# Altium schematic sheet POWER.SchDoc
size A4
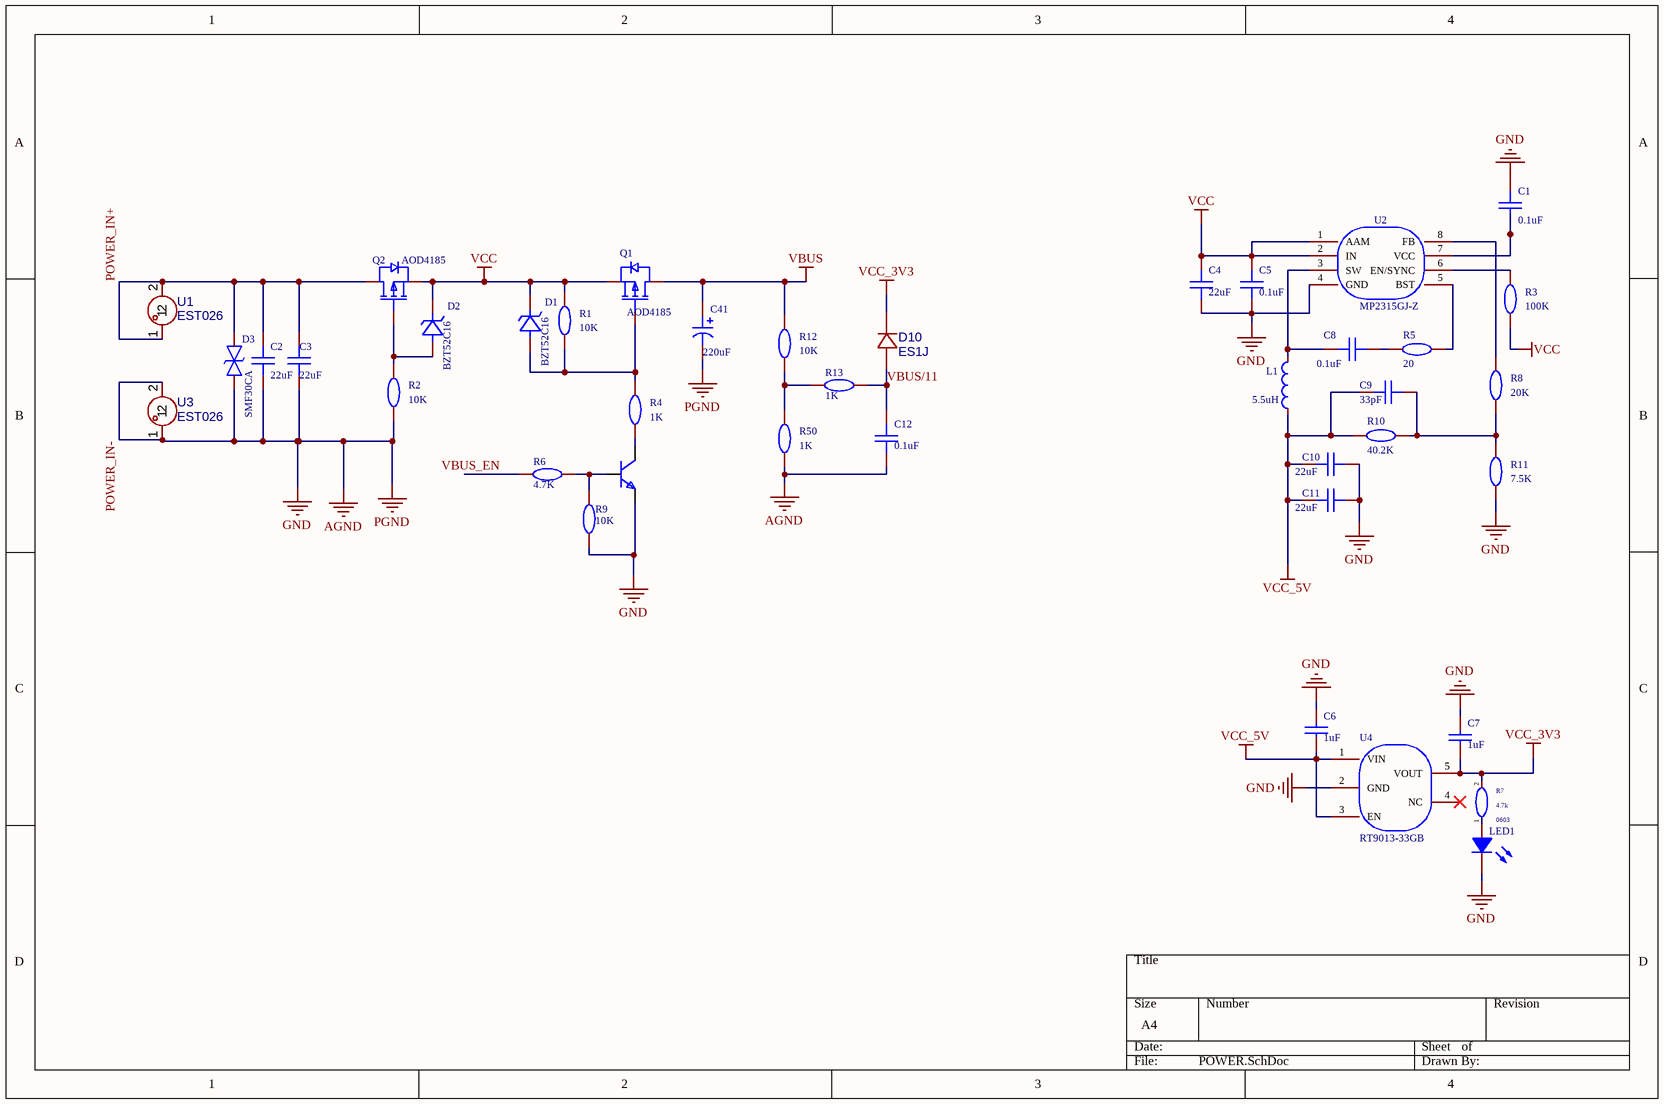
[diagram p0: POWER.SchDoc]

## Parts
C1  0.1uF  [C0603]
C2  22uF  [C0603]
C3  22uF  [C0603]
C4  22uF  [C0603]
C5  0.1uF  [C0603]
C6  1uF  [C0603]
C7  1uF  [C0603]
C8  0.1uF  [C0603]
C9  33pF  [C0603]
C10  22uF  [C0805]
C11  22uF  [C0805]
C12  0.1uF  [C0603]
C41  220uF  [CAP-SMD_BD6.3-L6.6-W6.6-FD]
D1  BZT52C16  [SOD-123_L2.7-W1.6-LS3.7-RD]
D2  BZT52C16  [SOD-123_L2.7-W1.6-LS3.7-RD]
D3  SMF30CA  [SOD-123_L2.7-W1.8-LS3.7-BI]
D10  ES1J  [SMA_L4.4-W2.8-LS5.4-RD]
L1  5.5uH  [IND-SMD_L10.5-W10.2-HSB-1050]
LED1  (no value)  [LED_0603]
Q1  AOD4185  [TO-252-2_L6.6-W6.1-P4.57-LS9.9-BR-CW]
Q2  AOD4185  [TO-252-2_L6.6-W6.1-P4.57-LS9.9-BR-CW]
Q3  s8050_c20069125  [SOT-23-3_L2.9-W1.3-P1.90-LS2.3-BR]  (value not drawn)
R1  10K  [R0603]
R2  10K  [R0603]
R3  100K  [R0603]
R4  1K  [R0603]
R5  20  [R0603]
R6  4.7K  [R0603]
R7  value 4.7k  Footprint_1: 0603  [R0603]  (hidden comment: My_Library_Res-0603)
R8  20K  [R0603]
R9  10K  [R0603]
R10  40.2K  [R0603]
R11  7.5K  [R0603]
R12  10K  [R0603]
R13  1K  [R0603]
R50  1K  [R0603]
U1  EST026  [CONN-TH_L6.3-W0.8-EST026]
U2  MP2315GJ-Z  [TSOT-23-8_L2.9-W1.6-P0.65-LS2.8-BR]
U3  EST026  [CONN-TH_L6.3-W0.8-EST026]
U4  RT9013-33GB  [SOT-23-5_L3.0-W1.7-P0.95-LS2.8-BL]

## Nets
POWER_IN-: C1.1 C2.1 C3.1 C4.1 C5.1 C6.2 C7.2 C10.2 C11.2 C12.1 C41.2 D3.1 LED1.1(C) Q3.2(E) R2.1 R9.2 R11.1 R50.1 U2.4(GND) U3.1 U3.2 U4.2(GND)  [also labelled AGND, GND, PGND]
VBUS: C41.1 Q1.2(D) R12.2
VCC: C4.2 C5.2 D1.1(K) D2.1(K) Q1.3(S) Q2.3(S) R1.2 R3.2 U2.1(AAM) U2.2(IN)
VCC_3V3: C7.1 D10.1(C) R7.2 U4.5(VOUT)
VCC_5V: C6.1 C9.1 C10.1 C11.1 L1.1 R10.2 U4.1(VIN) U4.3(EN)
POWER_IN+: C2.2 C3.2 D3.2 Q2.2(D) U1.1 U1.2
VBUS/11: C12.2 D10.2(A) R13.1
VBUS_EN: R6.1
NetC1_2: C1.2 U2.7(VCC)
NetC8_1: C8.1 L1.2 U2.3(SW)
NetC8_2: C8.2 R5.1
NetC9_2: C9.2 R8.1 R10.1 R11.2
NetD1_2: D1.2(A) Q1.1(G) R1.1 R4.2
NetD2_2: D2.2(A) Q2.1(G) R2.2
NetLED1_2: LED1.2(A) R7.1
NetQ3_1: Q3.1(B) R6.2 R9.1
NetQ3_3: Q3.3(C) R4.1
NetR3_1: R3.1 U2.6(EN/SYNC)
NetR5_2: R5.2 U2.5(BST)
NetR8_2: R8.2 U2.8(FB)
NetR12_1: R12.1 R13.2 R50.2

Not connected (* = marked no-connect by the designer): U4 4(NC)*

## Library data of the parts
C1-C5 C8 C9 C12 = CAP_0603: Symbol: Capacitance; 3D Model: ac125912035d415993ca9572d50418b1聨0819f05c4eef4c71ace90d822a990e87; 3D Model Transform: 62.992,31.496,0,0,0,0,0,0,0; ConvertToPcb: yes; ModelName: C0603_L1.6-W0.8-H0.8; Device: CAP_0603; Supplier Footprint: 0603; AddInBom: yes; FootprintName: C0603
  C1 C5 C8 C12: Value: 0.1uF
  C2-C4: Value: 22uF
  C9: Value: 33pF
C6 C7 = CL10B105KA8NNNC: 容值:1uF;精度:±10%;额定电压:25V;温度系数:X7R;; Manufacturer: SAMSUNG(三星); 3D Model: ac125912035d415993ca9572d50418b1聨0819f05c4eef4c71ace90d822a990e87; 3D Model Transform: 62.992,31.496,0,0,0,0,0,0,0; Tolerance: ±10%; Voltage Rating: 25V; Temperature Coefficient: X7R; AddInBom: yes; ModelName: C0603_L1.6-W0.8-H0.8; Symbol: CL10B105KA8NNNC; Device: CL10B105KA8NNNC; LCSC Part Name: 1uF ±10% 25V; Supplier Part: C29936; Manufacturer Part: CL10B105KA8NNNC; Supplier Footprint: 0603; JLCPCB Part Class: Extended Part; Datasheet: https://item.szlcsc.com/datasheet/CL10B105KA8NNNC/30690.html; Supplier: LCSC; Value: 1uF; ConvertToPcb: yes; FootprintName: C0603
C10 C11 = CAP_0805: Symbol: Capacitance; 3D Model: 1ba041120af144c991958decab20d241聨0819f05c4eef4c71ace90d822a990e87; 3D Model Transform: 78.74,51.181,0,0,0,0,0,0.0005,0; ConvertToPcb: yes; ModelName: C0805_L2.0-W1.3-H1.3; Device: CAP_0805; Supplier Footprint: 0805; Value: 22uF; AddInBom: yes; FootprintName: C0805
C41 = JVJ35V220M6x8: 容值:220uF;精度:±20%;额定电压:35V;纹波电流:190mA@120Hz;; Manufacturer: JIERR(捷而瑞); AddInBom: yes; ModelId: ec7f1c7bda5e4386b54ec5ff3d1d94ff聨0819f05c4eef4c71ace90d822a990e87; ModelTransform: 307.086,259.842,0,180,0,0,0,0,0; Tolerance: ±20%; Voltage Rating: 35V; Lifetime: 2000hrs@105℃; Symbol: JVJ35V220M6X8; Device: JVJ35V220M6x8; LCSC Part Name: 220uF ±20% 35V; SupplierPart: C46550411; ManufacturerPart: JVJ35V220M6x8; Supplier Footprint: SMD,D6.3xL7.7mm; JLCPCB Part Class: Extended Part; Datasheet: https://item.szlcsc.com/datasheet/JVJ35V220M6x8/48680105.html; Supplier: LCSC; ConvertToPcb: yes; FootprintName: CAP-SMD_BD6.3-L6.6-W6.6-FD; ModelName: CAP-SMD_BD6.3-L6.6-W6.6-FD; Value: 220uF; Ripple Current: 190mA@120Hz; Diameter: 6.3mm; Height - Seated (Max): 7.7mm; Operating Temperature: -55℃~+105℃
D1 D2 = BZT52C16: 二极管配置:独立式;稳压值(标称值):16V;稳压值(范围):15.3V~17.1V;耗散功率(Pd):500mW;; Manufacturer: Slkor(萨科微); Symbol: BZT52C16_C707145; 3D Model: ad7e39f9e5534b3c96ffdc5532ebb493聨0819f05c4eef4c71ace90d822a990e87; 3D Model Transform: 146.026,62.992,0,180,0,0,0.0005,0,0; Diode Configuration: 独立式; Zener Voltage(Nom): 16V; Reverse Leakage Current (Ir): 100nA; Pd - Power Dissipation: 500mW; Impedance(Zzt): 40Ω; Operating Junction Temperature Range: -65℃~+150℃; AddInBom: yes; ModelName: SOD-123_L2.7-W1.6-H1.4-LS3.7; Device: BZT52C16; LCSC Part Name: 独立式 耐压:16V 电流:0.1uA; Supplier Part: C707145; Manufacturer Part: BZT52C16; Supplier Footprint: SOD-123; JLCPCB Part Class: Extended Part; Datasheet: https://item.szlcsc.com/datasheet/BZT52C16/744267.html; Supplier: LCSC; Zener Voltage(Range): 15.3V~17.1V; ConvertToPcb: yes; FootprintName: SOD-123_L2.7-W1.6-LS3.7-RD
D3 = SMF30CA: 反向截止电压(Vrwm):30V;最大钳位电压:48.4V;峰值脉冲电流(Ipp):4.2A;击穿电压:33.3V;; Manufacturer: AnBon(安邦); Symbol: SMF30CA_C435498; 3D Model: 8576f175c34f41329e79954aa68cc529聨0819f05c4eef4c71ace90d822a990e87; 3D Model Transform: 145.669,70.866,0,0,0,0,0,0,0; Reverse Stand-Off Voltage (Vrwm): 30V; Maximum Clamping Voltage: 48.4V; Peak Pulse Current (Ipp): 4.2A; Breakdown Voltage: 33.3V; Reverse Leakage Current (Ir): 5uA; Type: TVS; AddInBom: yes; Device: SMF30CA; LCSC Part Name: SMF30CA; Supplier Part: C435498; Manufacturer Part: SMF30CA; Supplier Footprint: SOD-123; JLCPCB Part Class: Extended Part; Datasheet: https://atta.szlcsc.com/upload/public/pdf/source/20191009/C435508_DB7B75E48DB0811659B52C5D7F67F4F0.pdf; Supplier: LCSC; ConvertToPcb: yes; FootprintName: SOD-123_L2.7-W1.8-LS3.7-BI; ModelName: SOD-123_L2.7-W1.8-LS3.7-BI
D10 = ES1J_C412438: 二极管配置:独立式;正向压降(Vf):1.7V@1A;直流反向耐压(Vr):600V;整流电流:1A;反向恢复时间(Trr):35ns;; Manufacturer: MDD(辰达半导体); Symbol: ES1JG_C412438; AddInBom: yes; ModelId: 4f1e9ef2303f48b48aa8ce0cacf8d7b1; ModelTransform: 204.724,102.362,0,0,0,0,0,0,0; Diode Configuration: 独立式; Voltage - DC Reverse(Vr): 600V; Current - Rectified: 1A; Reverse Leakage Current (Ir): 5uA@600V; Reverse Recovery Time (trr): 35ns; Operating Junction Temperature Range: -55℃~+150℃@(Tj); Device: ES1J_C412438; LCSC Part Name: 耐压:600V 电流:1A 反向恢复时间：35ns; SupplierPart: C412438; ManufacturerPart: ES1J; Supplier Footprint: SMA; JLCPCB Part Class: 扩展库; Datasheet: https://item.szlcsc.com/datasheet/ES1J/404261.html; Supplier: LCSC; ConvertToPcb: yes; FootprintName: SMA_L4.4-W2.8-LS5.4-RD; ModelName: SMA_L4.4-W2.8-LS5.4-RD; Voltage - Forward(Vf@If): 1.7V@1A
L1 = HSB-1050-5R5-M: 电感值:5.5uH;精度:±20%;额定电流:10A;饱和电流(Isat):12A;; Manufacturer: YOUCHI(佑驰); Tolerance: ±20%; Current Rating: 10A; Current - Saturation(Isat): 12A; DC Resistance(DCR): 10.3mΩ; AddInBom: yes; Symbol: HSB-1050-5R5-M; Device: HSB-1050-5R5-M; LCSC Part Name: 5.5uH  ±20%  12.0A; Supplier Part: C53373579; Manufacturer Part: HSB-1050-5R5-M; Supplier Footprint: SMD,10.5x10.2mm; JLCPCB Part Class: Extended Part; Datasheet: https://item.szlcsc.com/datasheet/HSB-1050-5R5-M/56489689.html; Supplier: LCSC; Value: 5.5uH; ConvertToPcb: yes; FootprintName: IND-SMD_L10.5-W10.2-HSB-1050
LED1 = LED_0603-B: Symbol: LED_B; Convert to PCB: yes; 3D Model: eb8d964598f24248affda46f619856c5聨0819f05c4eef4c71ace90d822a990e87; 3D Model Transform: 63.1,31.6,23.7,0,0,0,0,0,0; ModelName: LED-0603_B; Device: LED_0603-B; Add into BOM: yes; Supplier Footprint: 0603; FootprintName: LED_0603
Q1 Q2 = AOD4185_C2984007: Manufacturer: ISC(无锡固电); 3D Model: ce57f84d66384067af8a68020b6de06d聨0819f05c4eef4c71ace90d822a990e87; 3D Model Transform: 259.842,390.52442,0,90,0,0,-39.39,0,0; AddInBom: yes; ModelName: TO-252-2L-3P_L6.6-W6.1-H2.3-LS10.1-P4.6; Symbol: AOD4185_C2984007; Device: AOD4185_C2984007; LCSC Part Name: AOD4185; Supplier Part: C2984007; Manufacturer Part: AOD4185; Supplier Footprint: TO-252; JLCPCB Part Class: Extended Part; Supplier: LCSC; ConvertToPcb: yes; FootprintName: TO-252-2_L6.6-W6.1-P4.57-LS9.9-BR-CW
Q3 = s8050_c20069125: 晶体管类型:NPN;集电极电流(Ic):500mA;集射极击穿电压(Vceo):25V;耗散功率(Pd):300mW;直流电流增益(hFE):120;; Manufacturer: R+O(宏嘉诚); ManufacturerPart: S8050; AddInBom: yes; ModelId: 5504beb8757f4de79731898ec55d3e54; ModelTransform: 114.173,90.551,0,90,0,0,0,0,0; type: NPN; Current - Collector(Ic): 500mA; Collector - Emitter Voltage VCEO: 25V; Pd - Power Dissipation: 300mW; DC Current Gain: 120; Transition frequency(fT): 100MHz; Current - Collector Cutoff: 100nA; Vce Saturation(VCE(sat)): 600mV; Emitter-Base Voltage(Vebo): 5V; Number: 1个NPN; Configuration: 独立式; Symbol: S8050_C20069125; LCSC Part Name: hFE:200-350，丝印:J3Y NPN 500mA 25V; SupplierPart: C20069125; Supplier Footprint: SOT-23; JLCPCB Part Class: Extended Part; Datasheet: https://item.szlcsc.com/datasheet/S8050/21397163.html; Supplier: LCSC; ConvertToPcb: yes; FootprintName: SOT-23-3_L2.9-W1.3-P1.90-LS2.3-BR; ModelName: SOT-23-3_L2.9-W1.3-P1.90-LS2.3-BR; Operating Temperature: -55℃~+150℃
R1-R3 R5 R8-R12 = Res_0603: Symbol: 电阻; 3D Model: fc143cca1e79419f9cd78b61e9279f08聨0819f05c4eef4c71ace90d822a990e87; 3D Model Transform: 31.8897,63.7794,0,90,0,0,0,0,0; ConvertToPcb: yes; Device: Res_0603; Supplier Footprint: 0603; AddInBom: yes; FootprintName: R0603; ModelName: R0603
  R1 R2 R9 R12: Value: 10K
  R3: Value: 100K
  R5: Value: 20
  R8: Value: 20K
  R10: Value: 40.2K
  R11: Value: 7.5K
R4 R6 R13 R50 = Res_0603: Symbol: 电阻; 3D Model: fc143cca1e79419f9cd78b61e9279f08聨0819f05c4eef4c71ace90d822a990e87; 3D Model Transform: 31.8897,63.7794,0,90,0,0,0,0,0; Value: 10K; ConvertToPcb: yes; Device: Res_0603; Supplier Footprint: 0603; AddInBom: yes; FootprintName: R0603; ModelName: R0603
R7 = My_Library_Res-0603: Origin Footprint: MyPCBLibrary:R0603; AddInBom: yes; Symbol: My_Library_Res-0603; Device: My_Library_Res-0603
U1 U3 = EST026: 环保; Manufacturer: xcfuse(旭程); AddInBom: yes; ModelId: caeb915258b34f389ee2048176497ca2; ModelTransform: 328.7395,78.74,0,0,0,0,0,0,-137.795; Symbol: EST026; Device: EST026; LCSC Part Name: EST026; SupplierPart: C52878; ManufacturerPart: EST026; Supplier Footprint: 插件; JLCPCB Part Class: 扩展库; Datasheet: https://item.szlcsc.com/datasheet/EST026/53893.html; Supplier: LCSC; ConvertToPcb: yes; FootprintName: CONN-TH_L6.3-W0.8-EST026; ModelName: CONN-TH_L6.3-W0.8-EST026
U2 = MP2315GJ-Z: 功能类型:降压型;工作电压:4.5V~24V;输出电压:800mV~22.8V;输出电流:3A;输出类型:可调;; Manufacturer: MPS(芯源); 3D Model: a4a866e84c1d4e21a00dbb6d6e7ebbb6聨0819f05c4eef4c71ace90d822a990e87; 3D Model Transform: 110.45568,114.173,0,180,0,0,0,0,0; Function: 降压型; Output Current: 3A; Frequency - Switching: 500kHz; Synchronous Rectifier: 是; Number of Outputs: 1; Topology: 降压式; Quiescent Current: 180uA; Switch tube (built-in/external): 内置; Output Type: 可调; AddInBom: yes; Symbol: MP2315GJ-Z; Device: MP2315GJ-Z; LCSC Part Name: 降压型 3A 4.5V~24V; Supplier Part: C45889; Manufacturer Part: MP2315GJ-Z; Supplier Footprint: TSOT-23-8; JLCPCB Part Class: Extended Part; Datasheet: https://item.szlcsc.com/datasheet/MP2315GJ-Z/46892.html; Supplier: LCSC; Voltage - Supply: 4.5V~24V; Output Voltage: 800mV~22.8V; Operating Temperature: -40℃~+125℃; Features: 轻载高效模式；内置LDO稳压器；频率同步；逐波限流；过流保护；打嗝限流; ConvertToPcb: yes; FootprintName: TSOT-23-8_L2.9-W1.6-P0.65-LS2.8-BR; ModelName: TSOT-23-8_L2.9-W1.6-P0.65-LS2.8-BR
U4 = RT9013-33GB: 输出极性:正极;工作电压:5.5V;输出电压:3.3V;输出电流:500mA;电源纹波抑制比(PSRR):50dB@(10kHz);输出类型:固定;; Manufacturer: RICHTEK(立锜); 3D Model: 0a2a1b8f50944f73965918ad6e5fe167聨0819f05c4eef4c71ace90d822a990e87; 3D Model Transform: 118.60433,114.173,0,90,0,0,0.0005,0.0005,0; Output Configuration: 正极; Voltage - Supply: 5.5V; Output Voltage: 3.3V; Output Current: 500mA; Voltage Dropout: 400mV@(500mA); standby current: 25uA; Noise: 30uVrms; Output Type: 固定; Number of Outputs: 1; AddInBom: yes; ModelName: SOT-23-5_L2.9-W1.6-H1.1-LS2.8-P0.95; Symbol: RT9013-33GB; Device: RT9013-33GB; LCSC Part Name: 3.3V 500mA 5.5V; Supplier Part: C47773; Manufacturer Part: RT9013-33GB; Supplier Footprint: SOT-23-5; JLCPCB Part Class: Extended Part; Datasheet: https://item.szlcsc.com/datasheet/RT9013-33GB/48778.html; Supplier: LCSC; Power Supply Rejection Ratio (PSRR): 50dB@(10kHz); Features: 使能控制；短路保护；过流保护；热关断; Operating Temperature: -40℃~+125℃@(Tj); ConvertToPcb: yes; FootprintName: SOT-23-5_L3.0-W1.7-P0.95-LS2.8-BL